# Altium schematic sheet RLC.SchDoc
size A4; SheetNumber: 1; SheetTotal: 1
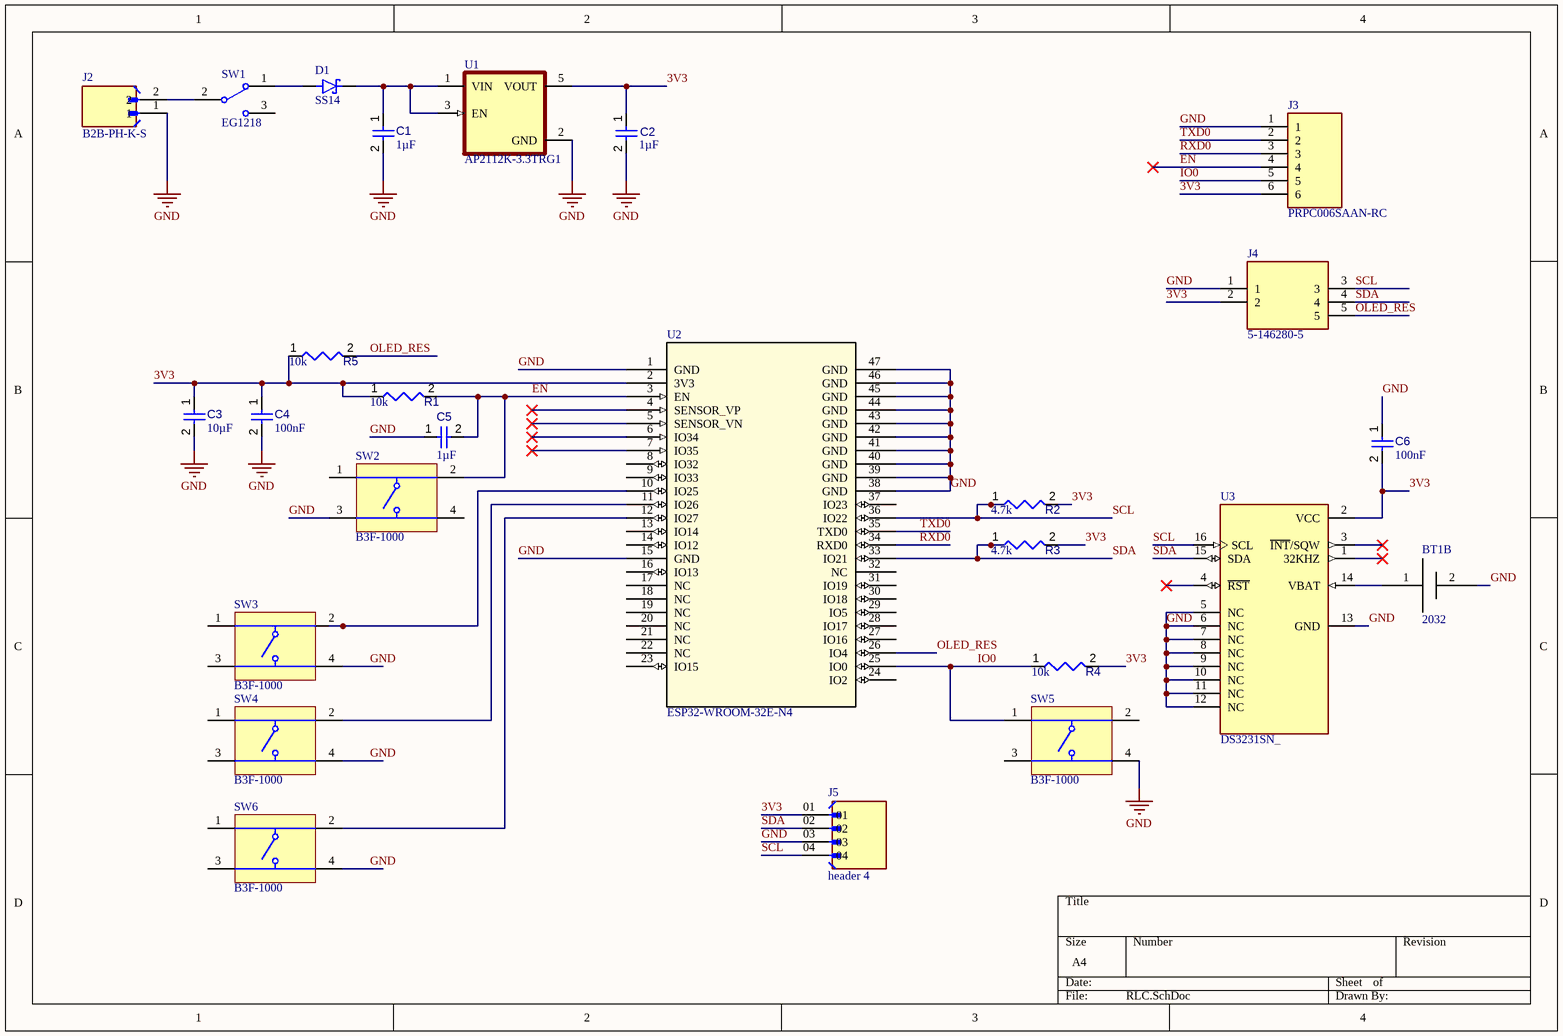
[diagram p0: RLC.SchDoc]

## Parts
BT1  2032  [PCBComponent_1]  (part B of 2)
C1  value 1µF  [CAPC1608X94X35NL15T15]  (hidden comment: Capacitor 1 uF +/- 10% 16 V 0603)
C2  value 1µF  [CAPC1608X94X35NL15T15]  (hidden comment: Capacitor 1 uF +/- 10% 16 V 0603)
C3  value 10µF  [CAPC0603(1608)100_L]  (hidden comment: Capacitor 10µF +/-20% 10V 0603)
C4  value 100nF  [CAPC0603(1608)100_L]  (hidden comment: Capacitor 100nF +/-20% 10V 0603)
C5  value 1µF  [CAPC0603(1608)100_L]  (hidden comment: Capacitor 10µF +/-20% 10V 0603)
C6  value 100nF  [CAPC0603(1608)100_L]  (hidden comment: Capacitor 10µF +/-20% 10V 0603)
D1  SS14  [SMA]
J2  B2B-PH-K-S  [JST_B2B-PH-K-S]
J3  PRPC006SAAN-RC  [HDRV6W64P0X254_1X6_1524X254X834P]
J4  5-146280-5  [TE_5-146280-5]
J5  header 4  [WURTH_61300411121]
R1  value 10k  [RESC2013X50X35ML15T15]  (hidden comment: Resistor 10k +/-1% 0805 125 mW)
R2  value 4.7k  [RESC2013X70X40ML20T20]  (hidden comment: Resistor 4k7 +/-1% 0805 125 mW)
R3  value 4.7k  [RESC2013X70X40ML20T20]  (hidden comment: Resistor 4k7 +/-1% 0805 125 mW)
R4  value 10k  [RESC2013X50X35ML15T15]  (hidden comment: Resistor 10k +/-1% 0805 125 mW)
R5  value 10k  [RESC2013X50X35ML15T15]  (hidden comment: Resistor 10k +/-1% 0805 125 mW)
SW1  EG1218  [ESWI-EG1218_V]
SW2  B3F-1000  [OMRON-B3F-1000-4_V]
SW3  B3F-1000  [OMRON-B3F-1000-4_V]
SW4  B3F-1000  [OMRON-B3F-1000-4_V]
SW5  B3F-1000  [OMRON-B3F-1000-4_V]
SW6  B3F-1000  [OMRON-B3F-1000-4_V]
U1  AP2112K-3.3TRG1  [SOT95P285X140-5N]
U2  ESP32-WROOM-32E-N4  [ESP32­WROOM­32E_EXP]
U3  DS3231SN_  [SOIC127P1032X265-16N]

## Nets
GND: BT1.2 C1.2 C2.2 C3.2 C4.2 C5.1 C6.1 J2.1 J3.1 J4.1 J5.03 SW2.3 SW3.4 SW4.4 SW5.4 SW6.4 U1.2(GND) U2.1(GND) U2.15(GND) U2.38(GND) U2.39(GND) U2.40(GND) U2.41(GND) U2.42(GND) U2.43(GND) U2.44(GND) U2.45(GND) U2.46(GND) U2.47(GND) U3.5(NC) U3.6(NC) U3.7(NC) U3.8(NC) U3.9(NC) U3.10(NC) U3.11(NC) U3.12(NC) U3.13(GND)
3V3: C2.1 C3.1 C4.1 C6.2 J3.6 J4.2 J5.01 R1.1 R2.2 R3.2 R4.2 R5.1 U1.5(VOUT) U2.2(3V3) U3.2(VCC)
EN: C5.2 J3.4 R1.2 SW2.2 U2.3(EN)
IO0: J3.5 R4.1 SW5.1 U2.25(IO0)
OLED_RES: J4.5 R5.2 U2.26(IO4)
RXD0: J3.3 U2.34(RXD0)
SCL: J4.3 J5.04 R2.1 U2.36(IO22) U3.16(SCL)
SDA: J4.4 J5.02 R3.1 U2.33(IO21) U3.15(SDA)
TXD0: J3.2 U2.35(TXD0)
NetBT1_1: BT1.1 U3.14(VBAT)
NetC1_1: C1.1 D1.P2(C) U1.1(VIN) U1.3(EN)
NetD1_P1: D1.P1(A) SW1.1
NetJ2_2: J2.2 SW1.2(COM)
NetSW3_2: SW3.2 U2.10(IO25)
NetSW4_2: SW4.2 U2.11(IO26)
NetSW6_2: SW6.2 U2.12(IO27)

Not connected (* = marked no-connect by the designer): SW1 3; SW2 1 4; SW3 1 3; SW4 1 3; SW5 2 3; SW6 1 3; U2 4(SENSOR_VP)* 5(SENSOR_VN)* 6(IO34)* 7(IO35)* 8(IO32) 9(IO33) 13(IO14) 14(IO12) 16(IO13) 17(NC) 18(NC) 19(NC) 20(NC) 21(NC) 22(NC) 23(IO15) 24(IO2) 27(IO16) 28(IO17) 29(IO5) 30(IO18) 31(IO19) 32(NC) 37(IO23); U3 1(32KHZ)* 3(~{INT}/SQW)* 4(~{RST})*

## Library data of the parts
BT1 = Component_1
C1 C2 = CMP-001-00003-6: Chip Capacitor, 1 uF, +/- 10%, 16 V, 0603 (1608 Metric); Voltage Rating: 16V; Capacitor Type: Ceramic; Max Operating Temperature: 125°C; Pins: 2; Tolerance: 10%; Min Operating Temperature: -55°C; RoHS Compliant: True; Mounting Technology: SM; Case/Package: 0603
C3 C5 C6 = CMP-001-00075-4: Chip Capacitor, 10µF +/-20%, 10V, 0603, Thickness 1 mm; Tolerance: 10%; Voltage Rating: 10V; Max Operating Temperature: 85°C; Pins: 2; Case/Package: 0603; Mounting Technology: SMT; Min Operating Temperature: -55°C
C4 = CMP-001-00075-4: Tolerance: 10%; Voltage Rating: 10V; Max Operating Temperature: 85°C; Pins: 2; Case/Package: 0603; Mounting Technology: SMT; Min Operating Temperature: -55°C
D1 = CMP-004-00031-1: Diode Schottky 40 V 1A Surface Mount DO-214AC (SMA); MF: ON; Case/Package: SMA-2 ON Semiconductor; Check_prices: https://www.snapeda.com/parts/SS14/Onsemi/view-part/?ref=eda; MP: SS14; Component Type: Standard; Pins: 2; Source: SS14.SchLib; SnapEDA_Link: https://www.snapeda.com/parts/SS14/Onsemi/view-part/?ref=snap; Design Item ID: SS14; Value: *
J2 = CMP-002-00073-1: Connector Header Through Hole 2 position 0.079 (2.00mm); MF: JST Sales America Inc.; Value: *; Pins: 2; MP: B2B-PH-K-S; Component Type: Standard; Source: B2B-PH-K-S.SchLib; SnapEDA_Link: https://www.snapeda.com/parts/B2B-PH-K-S/JST/view-part/?ref=snap; Design Item ID: B2B-PH-K-S; Case/Package: None; Check_prices: https://www.snapeda.com/parts/B2B-PH-K-S/JST/view-part/?ref=eda
J3 = CMP-002-00074-1: CONN HEADER VERT 6POS 2.54MM; Manufacturer_Name: Sullins; Geometry.Height: 8.34mm; Arrow Part Number: *; Design Item ID: PRPC006SAAN-RC; Source: PRPC006SAAN-RC.SchLib; Mouser Price/Stock: *; Manufacturer_Part_Number: PRPC006SAAN-RC; Datasheet Link: https://media.digikey.com/PDF/Data%20Sheets/Sullins%20PDFs/xRxCzzzSxxN-RC_ST_11635-B.pdf; Arrow Price/Stock: *; Mouser Part Number: *
J4 = CMP-031-000000-1: 05 MODII HDR SRST B/A .100CL; Component Type: Standard; Design Item ID: 5-146280-5; Package: None; MP: 5-146280-5; Value: *; Availability: Unavailable; Price: None; Source: 5-146280-5.SchLib; Pin Count: 5
J5 = CMP-002-00076-1: Connector Header Through Hole 4 position 0.100 (2.54mm); MF: WÃ¼rth Elektronik; Check_prices: https://www.snapeda.com/parts/61300411121/W%25C3%25BCrth+Elektronik+Midcom/view-part/?ref=eda; Value: *; Pins: 4; Case/Package: None; Design Item ID: 61300411121; SnapEDA_Link: https://www.snapeda.com/parts/61300411121/W%25C3%25BCrth+Elektronik+Midcom/view-part/?ref=snap; Component Type: Standard; MP: 61300411121; Source: 61300411121.SchLib
R1 R4 R5 = CMP-009-00018-5: Chip Resistor, 10 KOhm, +/- 1%, 125 mW, -55 to 155 degC, 0805 (2012 Metric); Power: 125mW; Voltage Rating: 150V; Tolerance: 1%; Pins: 2; Min Operating Temperature: -55°C; Case/Package: 0805; Max Operating Temperature: 155°C; RoHS Compliant: True; Mounting Technology: SM
R2 R3 = CMP-009-00032-5: Chip Resistor, 4.7 KOhm, +/- 1%, 0.125 W, -55 to 155 degC, 0805 (2012 Metric); Power: 125mW; Voltage Rating: 150V; Max Operating Temperature: 155°C; Min Operating Temperature: -55°C; Case/Package: 0805; RoHS Compliant: True; Pins: 2; Tolerance: 1%; Mounting Technology: SM
SW1 = CMP-1696-00002-1: Slide Switch, 500 V, -20 to 70 degC, 3-Pin THD, RoHS; Case\Package: SOT-23-5; Output Current: 150 mA; Nominal Output Voltage: 3.3 V; Max Power Dissipation: 250 mW; Min Input Voltage: 4.3 V; Outputs: 1; Max Input Voltage: 8 V; Dropout Voltage: 300 mV; PackageDescription: 3-Pin Through Hole Device, Body 11.6 x 4 mm, Pitch 2.5 mm; ComponentLink1URL: http://www.e-switch.ch/en/; RoHSCompliant: true; Length: 3 mm; ComponentLink1Description: Manufacturer URL; Power Rating: 250 mW; Mount: Surface Mount; Max Operating Temperature: 85 degC; REACH SVHC: No SVHC; Radiation Hardening: No; Height: 1.3 mm; Pins: 5; Max Ouput Current: 150 mA; Output Voltage: 3.3 V; Width: 1.8 mm; Package Quantity: 3000; ComponentLink2URL: https://www.e-switch.com/system/asset/product_line/data_sheet/119/EG.pdf; Min Operating Temperature: -40 degC; ComponentLink2Description: Datasheet; DatasheetVersion: Oct-15; PackageReference: EG1218; Packaging: Tape and Reel
SW2-SW6 = CMP-011-00004-2: Tactile Switch, SPST-NO, 0.05 A, 24 V, -25 to 70 degC, 4-Pin THD, RoHS, Bulk; Manufacturer: Omron Electronic Components; Throw Configuration: SPST; Max Contact Resistance: 100mohm; Resistance: 0.1Ohm; Max Current Rating: 50mA; Voltage Rating: 24V; Operating Force: 100gf; Datasheet Version: Jan-15; Case/Package: B3F-1000; Packaging: Bulk; Package Description: 4-Pin Through Hole Device, Body 6 x 6 mm; Manufacturer URL: http://www.omron.com/; Package Reference: B3F-1000; Contact Plating: Gold; Contact Current Rating: 50mA; RoHS Compliant: True; Contact Material: Gold; Mounting Technology: TH; Max Operating Temperature: 70°C; Min Operating Temperature: -25°C; Package Quantity: 1500; Datasheet URL: http://www.omron.com/ecb/products/pdf/en-b3f.pdf; Voltage Rating (DC): 24V; Pins: 4; Current Rating: 50mA; Max Voltage Rating (DC): 24V
U1 = CMP-031-00006-1: Linear Voltage Regulator IC Positive Fixed 1 Output 600mA SOT-25; MF: Diodes Inc.; Check_prices: https://www.snapeda.com/parts/AP2112K-3.3TRG1/Diodes+Inc./view-part/?ref=eda; Source: AP2112K-3.3TRG1.SchLib; Case/Package: SOT-753 Diodes Inc.; Component Type: Standard; SnapEDA_Link: https://www.snapeda.com/parts/AP2112K-3.3TRG1/Diodes+Inc./view-part/?ref=snap; MP: AP2112K-3.3TRG1; Design Item ID: AP2112K-3.3TRG1; Pins: 4; Purchase-URL: https://pricing.snapeda.com/search/part/AP2112K-3.3TRG1/?ref=eda; Availability: In Stock; Price: None; Value: *
U2 = CMP-017-000000-1: Description; Manufacturer_Name: Espressif Systems; Manufacturer_Part_Number: ESP32-WROOM-32E-N4; Source: ESP32-WROOM-32E-N4.SchLib; Type: Type; Copyright: Copyright (C) 2025 Ultra Librarian. All rights reserved.; RefDes: RefDes; Design Item ID: ESP32-WROOM-32E-N4
U3 = CMP-031-00007-1: Real Time Clock (RTC) IC Clock/Calendar - IÂ²C, 2-Wire Serial 16-SOIC (0.295, 7.50mm Width); MP: DS3231SN#; MF: Maxim Integrated; Value: *; Component Type: Standard; Availability: In Stock; Design Item ID: DS3231SN_; Pins: 16; Purchase-URL: https://pricing.snapeda.com/search/part/DS3231SN#/?ref=eda; Check_prices: https://www.snapeda.com/parts/DS3231SN%23/Maxim+Integrated/view-part/?ref=eda; Source: DS3231SN_.SchLib; Case/Package: SOIC-16 Maxim; SnapEDA_Link: https://www.snapeda.com/parts/DS3231SN%23/Maxim+Integrated/view-part/?ref=snap; Price: None